# EasyEDA Pro project F411主控板优化版(1).epro

# Schematic Schematic1
Board Name: Board1; Create Date: 2025-06-30; Page Name: P1; Project Name: F411主控板优化版; Schematic Name: Schematic1; Update Date: 2025-06-30; Company: 嘉立创EDA; Page Size: A4; Version: V1.0
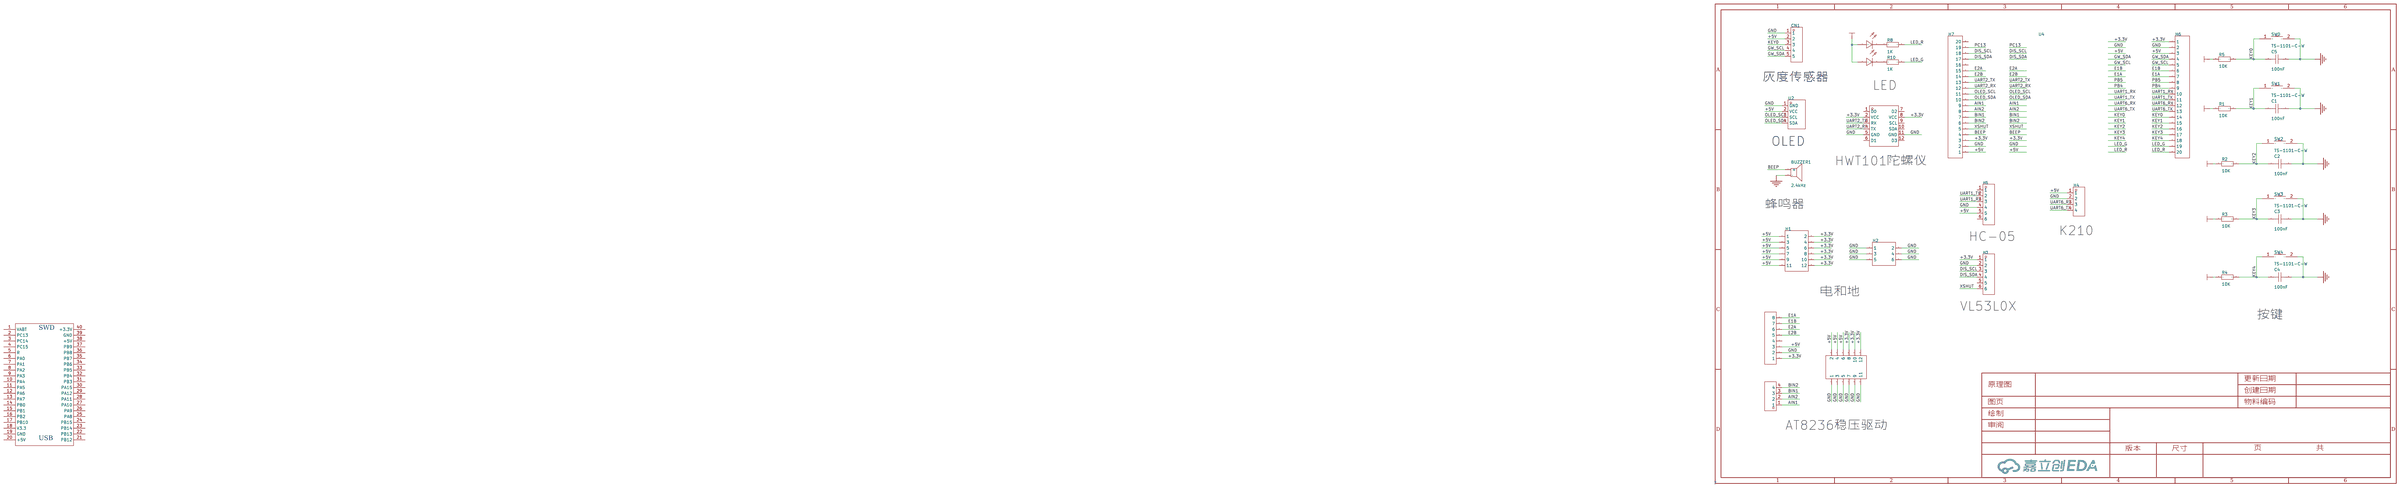
[diagram p0: schematic sheet]

## Parts
AT82361p4  -  [HDR-TH_4P-P2.54-V-F]
AT82362p6  -  [HDR-TH_12P-P2.54-V-M-R2-C6-S2.54]
BUZZER1  2.4kHz  [BUZ-TH_BD12.0-P7.60-D0.6-FD]
C1  100nF  [C0805]
C2  100nF  [C0805]
C3  100nF  [C0805]
C4  100nF  [C0805]
C5  100nF  [C0805]
CN1  灰度传感器  [CONN-TH_5P-P2.54_XH-5AW_C2908614]
H1  -  [HDR-TH_12P-P2.54-V-M-R2-C6-S2.54]
H2  -  [HDR-TH_6P-P2.54-V-F-R2-C3-S2.54]
H3  -  [HDR-TH_6P-P2.54-V-F]
H4  -  [HDR-TH_4P-P2.54-V-F]
H5  -  [HDR-TH_6P-P2.54-V-F]
H6  -  [HDR-TH_20P-P2.54-V-F]
H7  -  [HDR-TH_20P-P2.54-V-F]
LED1  -  [LED_TH-3mm]
LED2  -  [LED_TH-3mm]
R1  10K  [R0805]
R2  10K  [R0805]
R3  10K  [R0805]
R4  10K  [R0805]
R5  10K  [R0805]
R8  1K  [R0805_1]
R10  1K  [R0805_1]
SW0  TS-1101-C-W  [SW-SMD_L6.0-W3.3-LS8.0]
SW1  TS-1101-C-W  [SW-SMD_L6.0-W3.3-LS8.0]
SW2  TS-1101-C-W  [SW-SMD_L6.0-W3.3-LS8.0]
SW3  TS-1101-C-W  [SW-SMD_L6.0-W3.3-LS8.0]
SW4  TS-1101-C-W  [SW-SMD_L6.0-W3.3-LS8.0]
U1  -  [HDR-TH_8P-P2.54-V-F-1]
U2  OLED  [OLED-TH_L27.8-W27.2-P2.54_C9900033791]
U3  -  [HWT101]
U4  -  [STM32F411CEU6核心板]

## Library data of the parts
AT82361p4 H4 = HDR-F_2.54_1x4P: Supplier Part: C2718488; Supplier Footprint: 插件
AT82362p6 H1 = HDR-F_2.54_2x6
BUZZER1 = TMB12A05_C96093: 驱动方式:有源(内含驱动线路);构造类型:电磁式;额定电压:-;频率:2.4kHz;声压(SPL):85dB;; LCSC Part Name: TMB12A05; Supplier Part: C96093; Manufacturer: 华能; Manufacturer Part: TMB12A05; Supplier Footprint: 插件,D=12mm; JLCPCB Part Class: 扩展库; Datasheet: https://atta.szlcsc.com/upload/public/pdf/source/20241025/8A17FE04D767D19A35A06DEF9A82AB1E.pdf; Supplier: LCSC; Driver Circuitry: 有源(内含驱动线路); Technology: 电磁式; Voltage - Supply: 4V~8V; Sound Pressure Level(SPL): 85dB; Diameter(φD): 12mm; Height: 9.8mm
C1-C5 = CAP_0805: Supplier Footprint: 0805
CN1 = XH-5AW: 插针结构:1x5P;间距:2.54mm;安装方式:弯插;参考系列:XH;总PIN数:5P;排数:1;每排PIN数:5;行距:-;额定电流:3A;触头材质:黄铜;触头镀层:锡;工作温度范围:-25℃~+85℃;; LCSC Part Name: 1x5P 间距:2.54mm 弯插 系列:XH; Supplier Part: C2908614; Manufacturer: HCTL(华灿天禄); Supplier Footprint: 弯插,P=2.5mm; JLCPCB Part Class: 扩展库; Datasheet: https://atta.szlcsc.com/upload/public/pdf/source/20230711/B565BAF3B11666EF6B81B3605408F2BD.pdf; Supplier: LCSC; Pins Structure: 1x5P; Pitch: 2.54mm; Mounting Style: 弯插; Reference Series: XH; Number of Pins: 5P; Number of Rows: 1; Number of PINs Per Row: 5; Current Rating (Max): 3A; Contact Material: 黄铜; Contact Plating: 锡; Operating Temperature Range: -25℃~+85℃
H2 = HDR-F_2.54_2x3: Supplier Part: C92272; Supplier Footprint: 插件
H3 H5 = HDR-F_2.54_1x6P: Supplier Part: C40877; Supplier Footprint: 插件
H6 H7 = HDR-F_2.54_1x20P: Supplier Part: C50984; Supplier Footprint: 插件
LED1 = LED_TH-R_3mm: Supplier Footprint: 插件
LED2 = LED_TH-G_3mm: Supplier Footprint: 插件
R1-R5 = Res_0805: Supplier Footprint: 0805
R8 R10 = Res_0603: Supplier Footprint: 0603
SW0-SW4 = TS-1101-C-W: 电路结构:单刀单掷;按钮形状:矩形按钮;作用力:260gf;安装方式:立贴;开关长度:6mm;开关宽度:3.6mm;开关高度:2.5mm;带支架:不带;触点电流:50mA;额定电压(AC):-;额定电压(DC):12V;额定功率:-;绝缘电阻:-;带灯:无;机械寿命:5万次;; LCSC Part Name: 6*3.6*2.5mm 立贴 轻触开关; Supplier Part: C318938; Manufacturer: XKB Connectivity(中国星坤); Supplier Footprint: SMD; JLCPCB Part Class: 扩展库; Datasheet: https://atta.szlcsc.com/upload/public/pdf/source/20200227/C318938_C2E53B1EEDE37D980A33616AC086DE53.pdf; Supplier: LCSC; Circuit: 单刀单掷; Actuator Style: 矩形按钮; Operating Force: 260gf; Mounting Style: 立贴; Switch Length: 6mm; Switch Width: 3.6mm; Switch Height: 2.5mm; Strike Gundam: 不带; Contact Current: 50mA; Voltage Rating (DC): 12V; Actuator/Cap Color: 白色带淡绿; With Lamp: 无; Mechanical Life: 5万次; Operating Temperature: -30℃~+85℃
U1 = HDR-F_2.54_1x8P: Supplier Part: C27438; Supplier Footprint: 插件
U2 = HS96L03W2C03: 主控芯片:SSD1315;接口类型:I2C;尺寸(inch):0.96;像素分辨率:128x64;; LCSC Part Name: 0.96寸OLED显示屏窄白光IIC; Supplier Part: C5248080; Manufacturer: HS(汉昇); JLCPCB Part Class: 扩展库; Datasheet: https://atta.szlcsc.com/upload/public/pdf/source/20230627/763D01F79A90007632F098068C7C8AD9.pdf; Supplier: LCSC; Main Control Chip: SSD1315; Interface Type: I2C; Size: 0.96; Pixel Resolution: 128x64; Operating Temperature: -40℃~+70℃
U3 = HWT101: Pin Type: IN
U4 = STM32F411CEU6核心板

## Nets
+3.3V: AT82362p6.8 AT82362p6.10 AT82362p6.12 H1.2 H1.4 H1.6 H1.8 H1.10 H1.12 H3.1 H6.1 H7.3 LED1.1(C) LED2.1(C) R1.1 R2.1 R3.1 R4.1 R5.1 U1.1 U3.2(VCC) U3.8(VCC)
+5V: AT82362p6.2 AT82362p6.4 AT82362p6.6 CN1.2 H1.1 H1.3 H1.5 H1.7 H1.9 H1.11 H4.1 H5.5 H6.3 H7.1 U1.3 U2.2(VCC)
GND: AT82362p6.1 AT82362p6.3 AT82362p6.5 AT82362p6.7 AT82362p6.9 AT82362p6.11 BUZZER1.2 C1.2 C2.2 C3.2 C4.2 C5.2 CN1.1 H2.1 H2.2 H2.3 H2.4 H2.5 H2.6 H3.2 H4.2 H5.4 H6.2 H7.2 SW0.2 SW1.2 SW2.2 SW3.2 SW4.2 U1.2 U2.1(GND) U3.5(GND) U3.11(GND)
AIN1: AT82361p4.1 H7.9
AIN2: AT82361p4.2 H7.8
BEEP: BUZZER1.1(+) H7.4
BIN1: AT82361p4.3 H7.7
BIN2: AT82361p4.4 H7.6
DIS_SCL: H3.3 H7.18
DIS_SDA: H3.4 H7.17
E1A: H6.7 U1.8
E1B: H6.6 U1.7
E2A: H7.15 U1.6
E2B: H7.14 U1.5
GW_SCL: CN1.4 H6.5
GW_SDA: CN1.5 H6.4
KEY0: C5.1 CN1.3 H6.14 R5.2 SW0.1
KEY1: C1.1 H6.15 R1.2 SW1.1
KEY2: C2.1 H6.16 R2.2 SW2.1
KEY3: C3.1 H6.17 R3.2 SW3.1
KEY4: C4.1 H6.18 R4.2 SW4.1
LED_G: H6.19 R10.2
LED_R: H6.20 R8.2
OLED_SCL: H7.11 U2.3(SCL)
OLED_SDA: H7.10 U2.4(SDA)
PB4: H6.9
PB5: H6.8
PC13: H7.19
UART1_RX: H5.3 H6.10
UART1_TX: H5.2 H6.11
UART2_RX: H7.12 U3.4(TX)
UART2_TX: H7.13 U3.3(RX)
UART6_RX: H4.3 H6.12
UART6_TX: H4.4 H6.13
XSHUT: H3.6 H7.5
Net-(LED1-2): LED1.2(A) R8.1
Net-(LED2-2): LED2.2(A) R10.1

Not connected (* = marked no-connect by the designer): H3 5; H5 1 6; H7 16 20; U1 4; U3 1(D0) 6(D1) 7(D2) 9(SCL) 10(SDA) 12(D3); U4 1(VABT) 2(PC13) 3(PC14) 4(PC15) 5(R) 6(PA0) 7(PA1) 8(PA2) 9(PA3) 10(PA4) 11(PA5) 12(PA6) 13(PA7) 14(PB0) 15(PB1) 16(PB2) 17(PB10) 18(V3.3) 19(GND) 20(+5V) 21(PB12) 22(PB13) 23(PB14) 24(PB15) 25(PA8) 26(PA9) 27(PA10) 28(PA11) 29(PA12) 30(PA15) 31(PB3) 32(PB4) 33(PB5) 34(PB6) 35(PB7) 36(PB8) 37(PB9) 38(+5V) 39(GND) 40(+3.3V)

## Notes on the sheet
- LED
- HWT101陀螺仪
- 蜂鸣器
- K210
- HC-05
- 电和地
- VL53L0X
- 按键
- AT8236稳压驱动

# Board PCB1
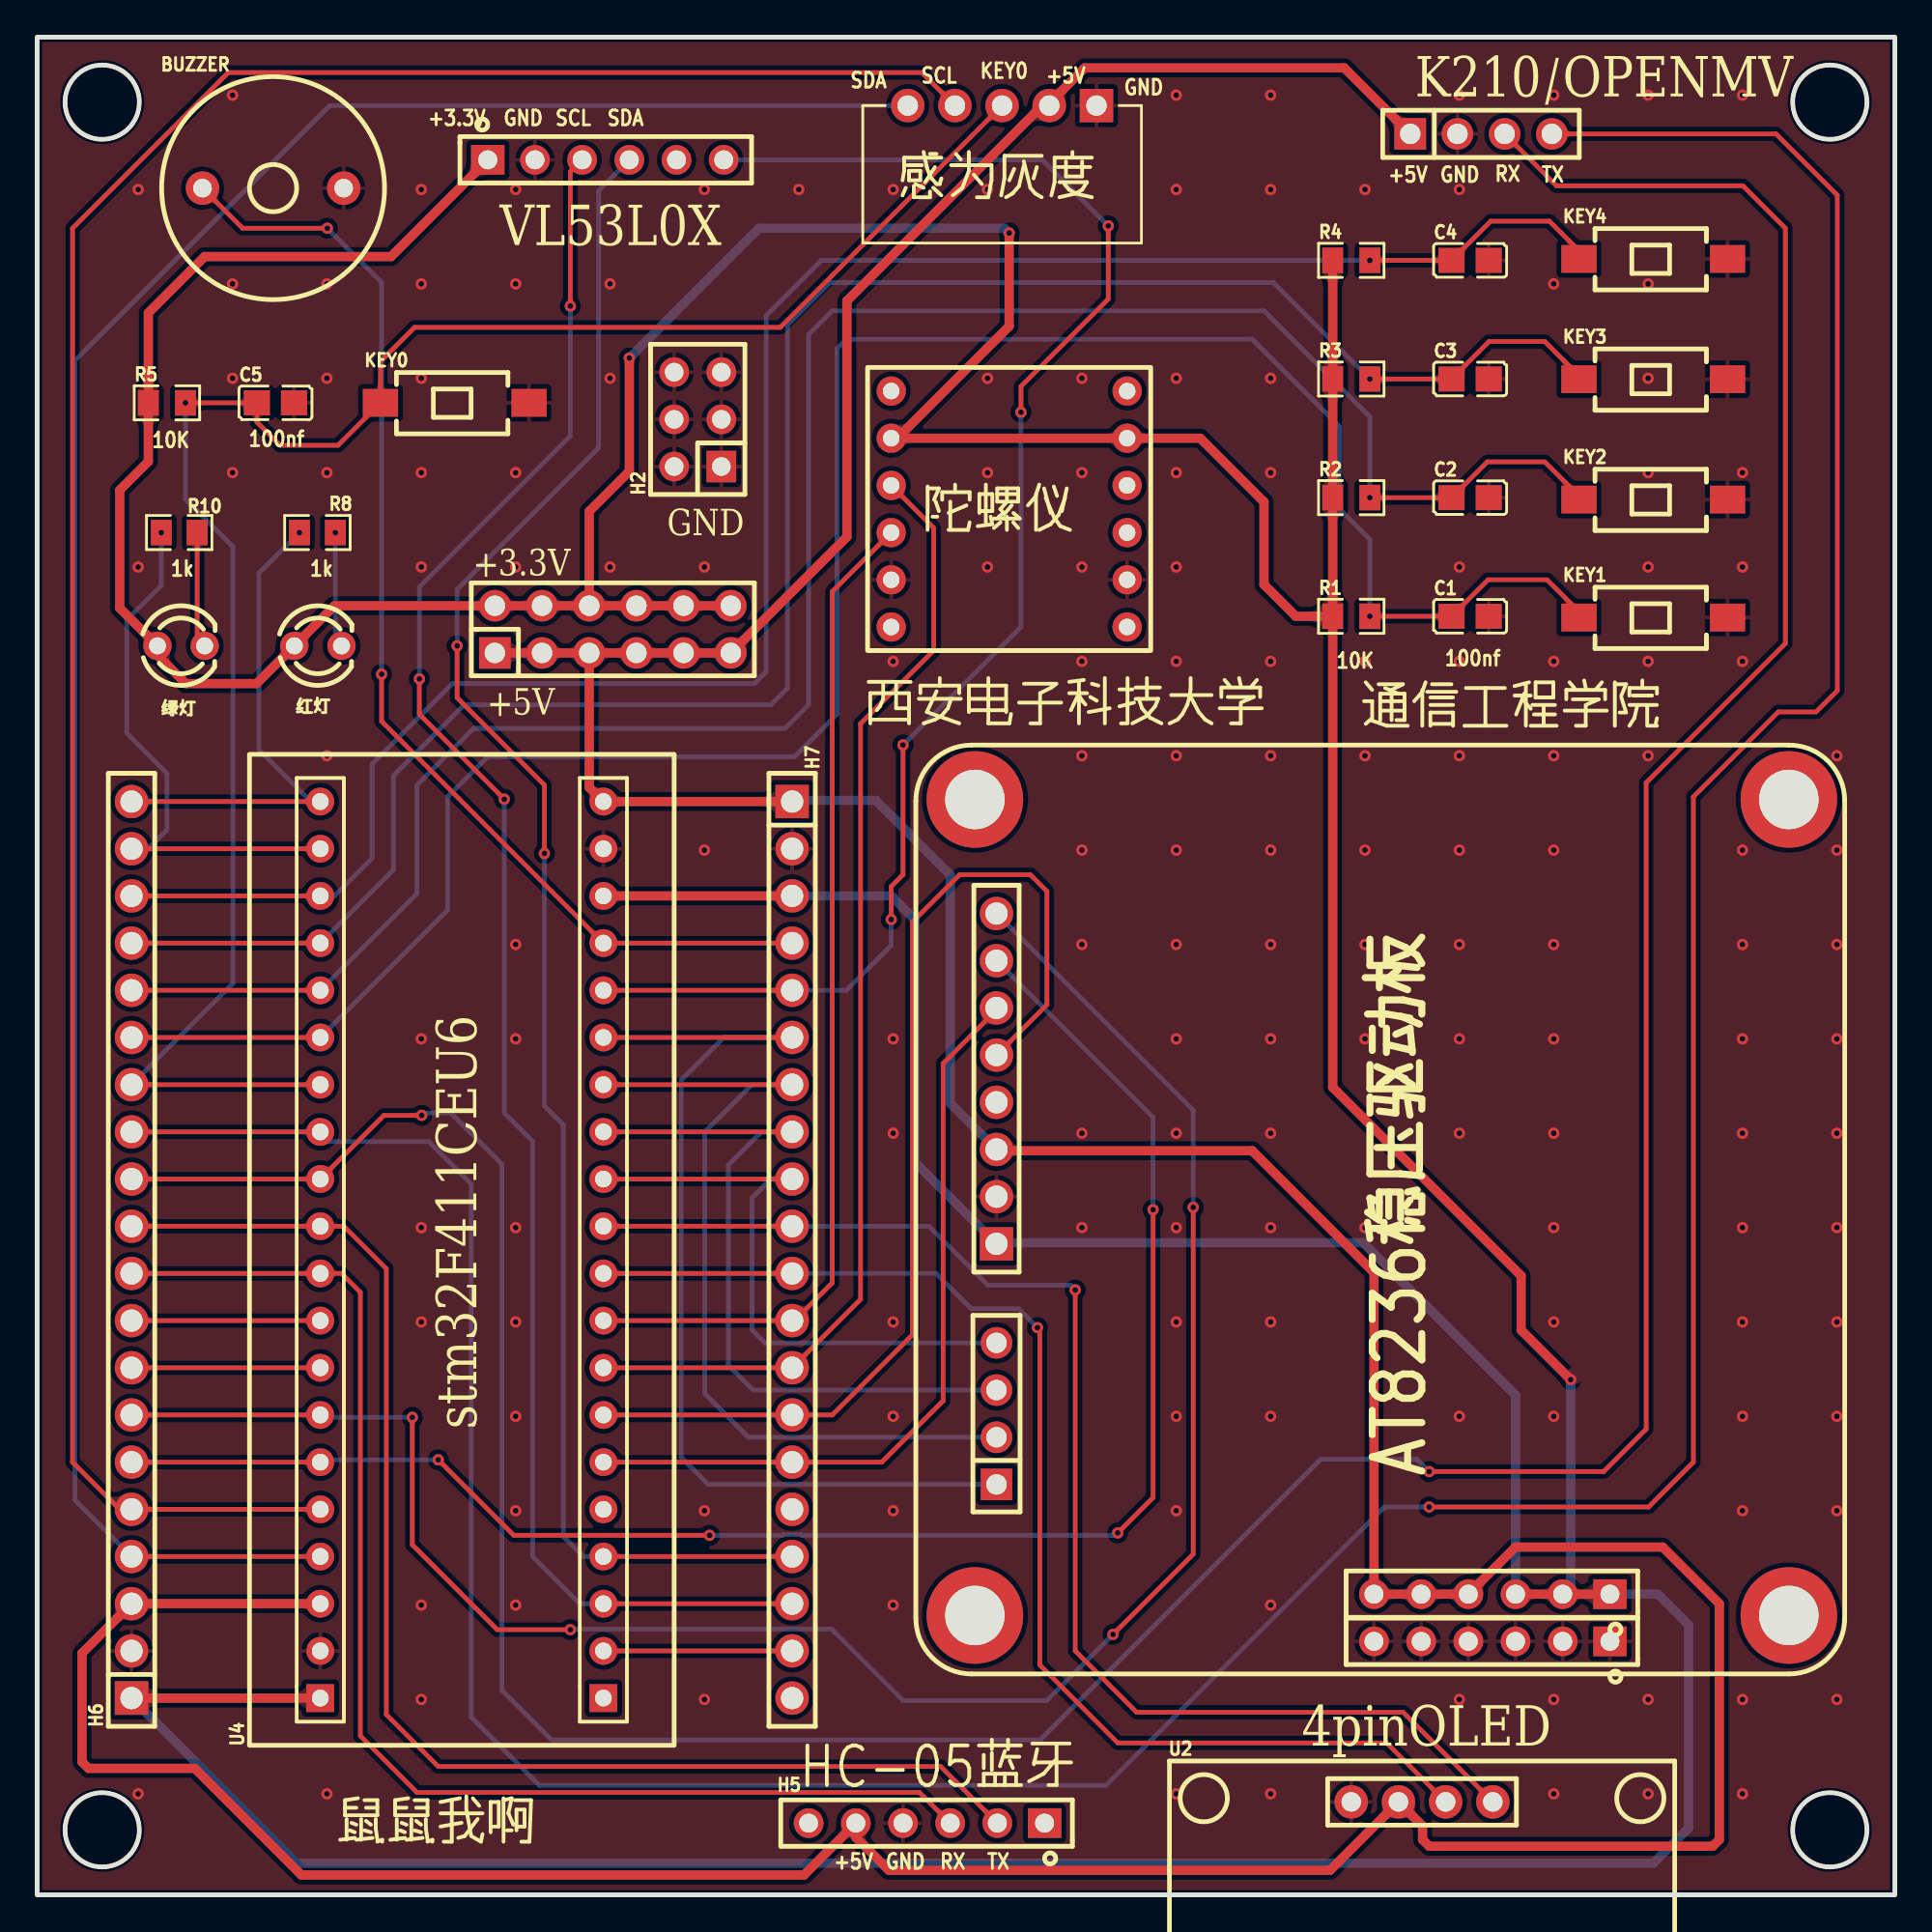
[diagram p1: board, top side]
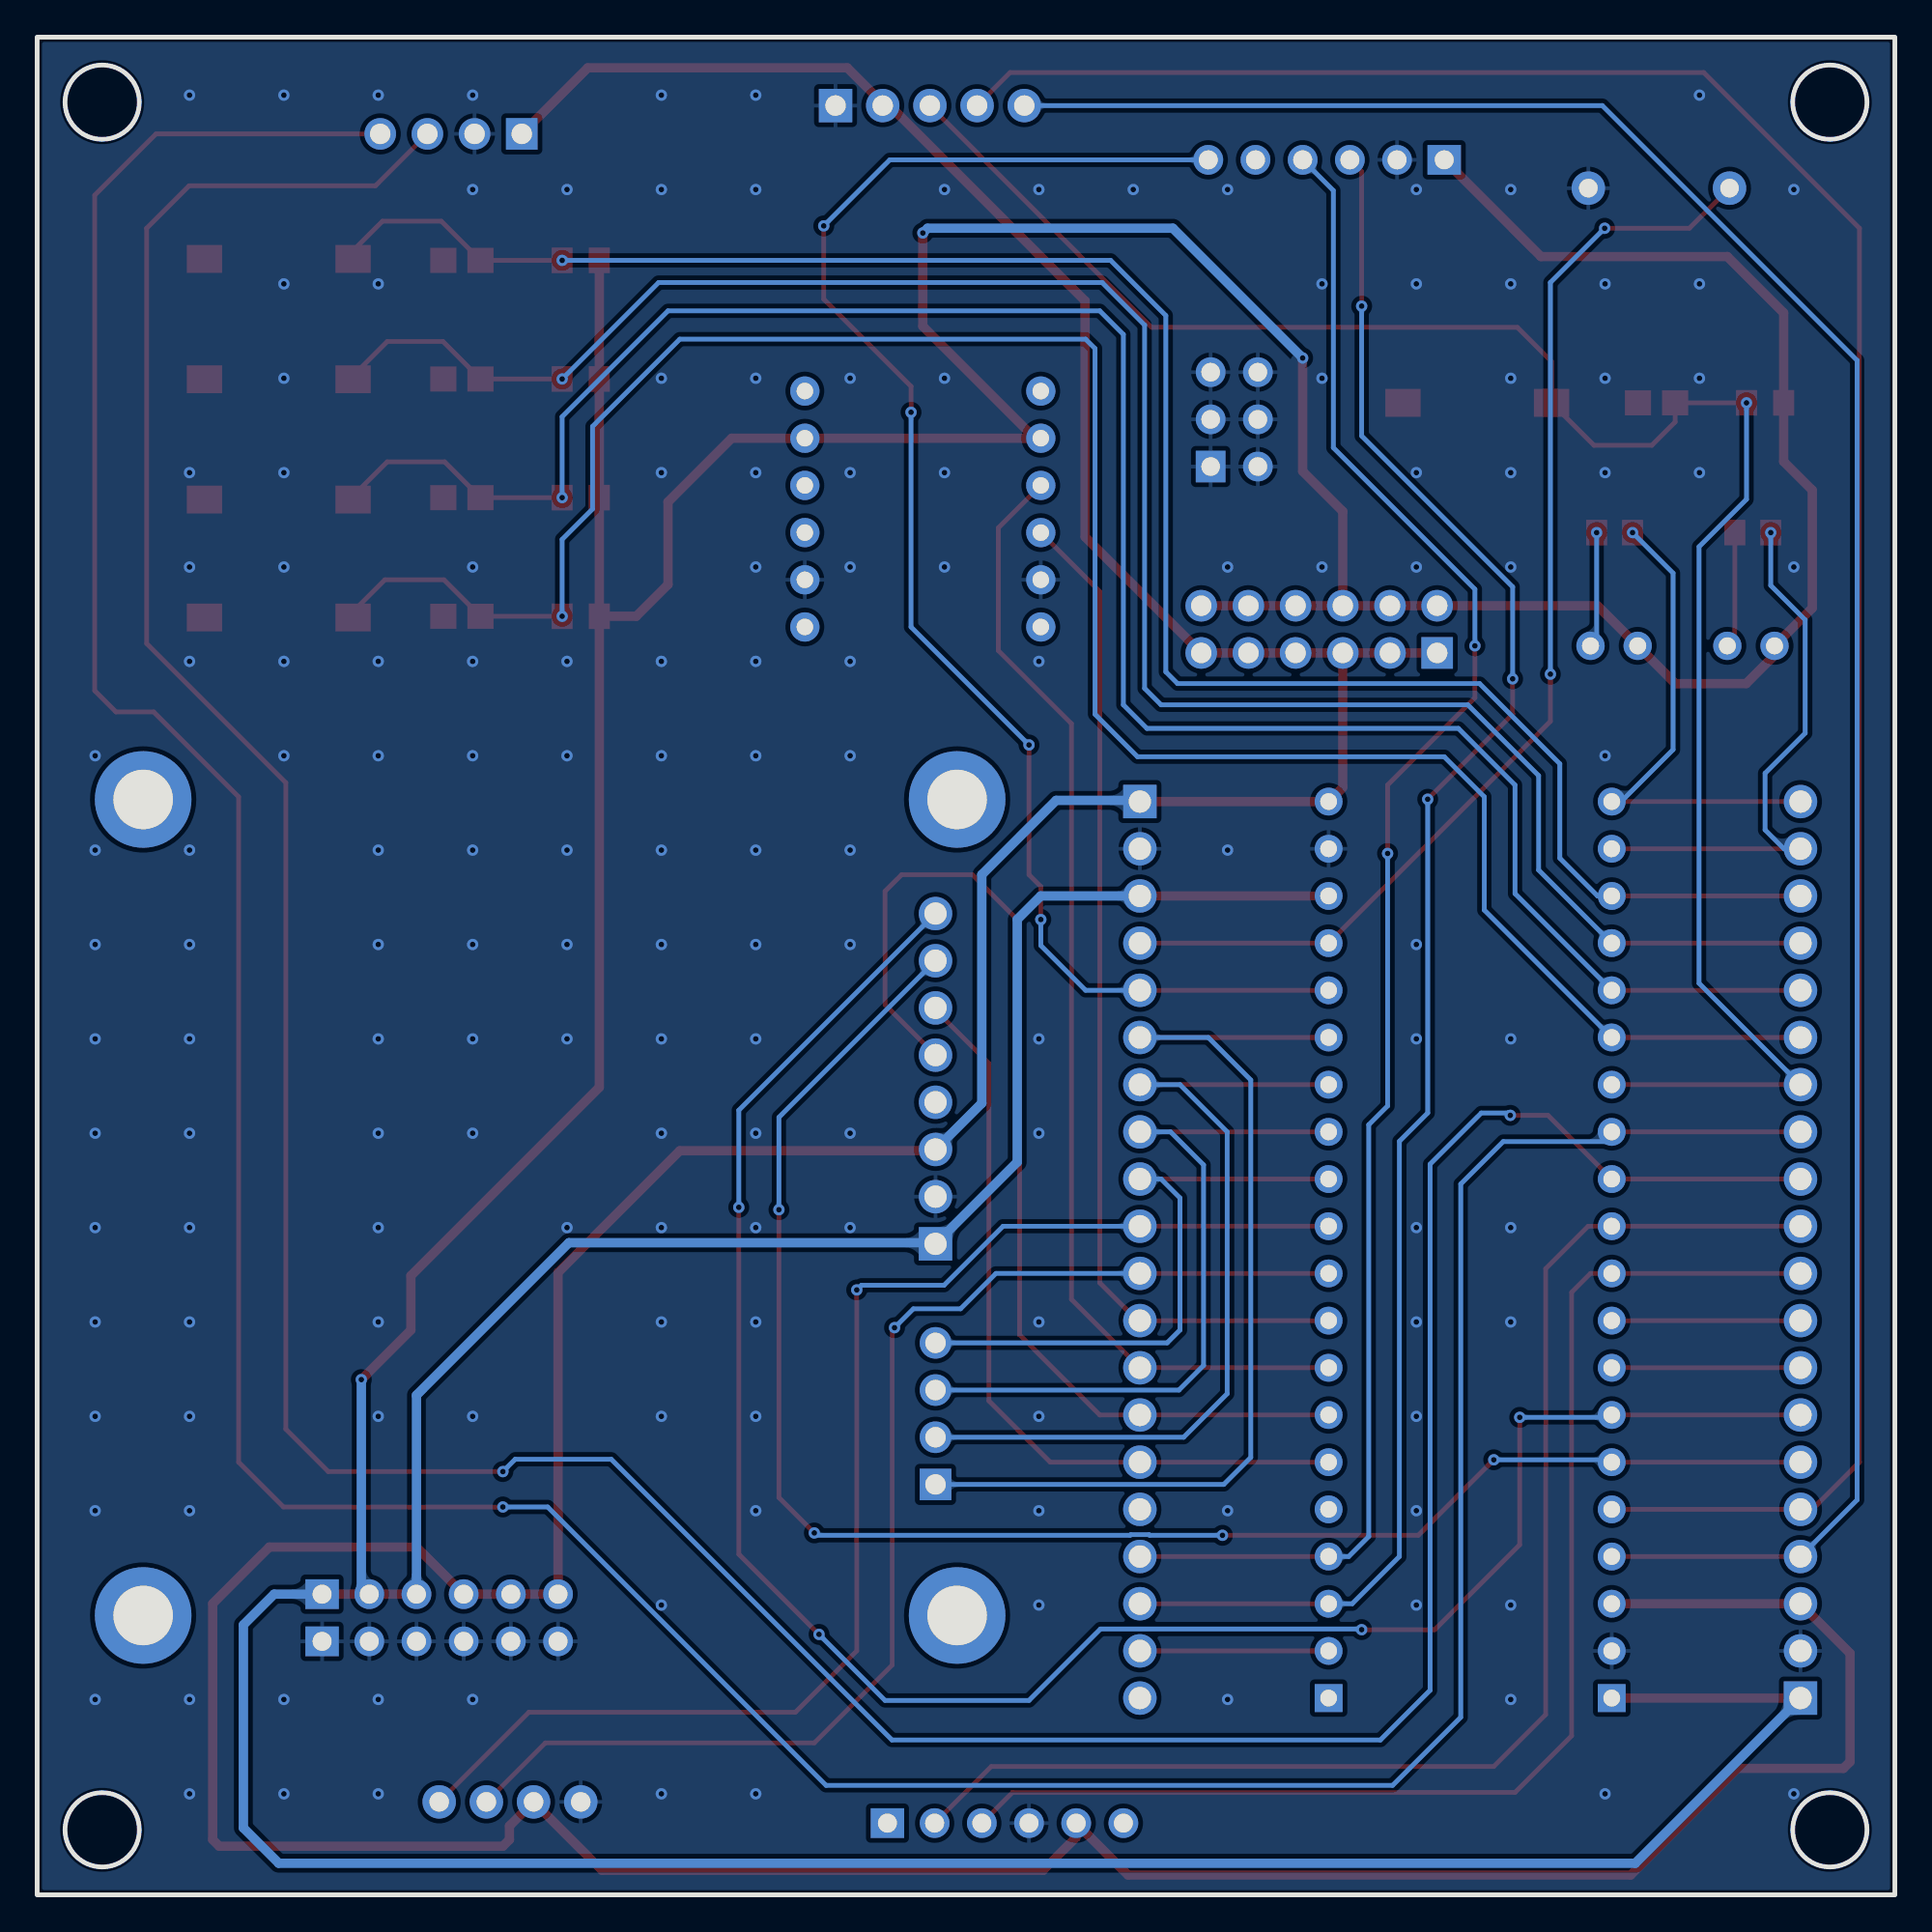
[diagram p2: board, bottom side, seen from below]

Outline 100 x 100 mm; copper layers: Top Layer, Bottom Layer. Coordinates in mm from the lower left corner of the outline.
Outline path: rectangle 0,100 100,0 ; circle c3.5,96.5 r2 ; circle c3.5,3.5 r2 ; circle c96.5,96.5 r2 ; circle c96.5,3.5 r2
Stack: Top Layer 0.035mm / Dielectric1 1.51mm FR4 er 4.5 / Bottom Layer 0.035mm

## Design rules (mm)
template: JLCPCB Capability(Two Layers Board)
spacing copperThickness1oz (default): track to track 0.102, other pairs 0.152 to 0.3
spacing copperThickness2oz: track to track 0.203, other pairs 0.152 to 0.3
track width copperThickness1oz (default): min 0.127, default 0.254, max 2.54
track width copperThickness2oz: min 0.203, default 0.254, max 2.54
differential pair differentialPair (default): width min 0.127, default 0.254, max 2.54; gap min 0.152, default 0.152
via viaSize (default): diameter min 0.5, default 0.61, max 10; hole min 0.3, default 0.305, max 6.3

## Placement (name value [footprint] x y rotation side)
BUZZER  2.4kHz  [BUZ-TH_BD12.0-P7.60-D0.6-FD]  12.7 91.87 0 top
C1  100nF  [C0805]  77.14 68.83 0 top
C2  100nF  [C0805]  77.14 75.21 0 top
C3  100nF  [C0805]  77.14 81.6 0 top
C4  100nF  [C0805]  77.14 87.98 0 top
C5  100nF  [C0805]  12.83 80.31 0 top
CN1  灰度传感器  [CONN-TH_5P-P2.54_XH-5AW_C2908614]  51.94 96.32 180 top
H1  -  [HDR-TH_12P-P2.54-V-M-R2-C6-S2.54]  30.99 68.12 0 top
H2  -  [HDR-TH_6P-P2.54-V-F-R2-C3-S2.54]  35.56 79.43 90 top
H3  -  [HDR-TH_6P-P2.54-V-F]  30.61 93.4 0 top
H4  -  [HDR-TH_4P-P2.54-V-F]  77.72 94.79 0 top
H5  -  [HDR-TH_6P-P2.54-V-F]  47.88 3.86 180 top
H6  -  [HDR-TH_20P-P2.54-V-F]  5.08 34.72 90 top
H7  -  [HDR-TH_20P-P2.54-V-F]  40.64 34.72 270 top
H20  -  [HDR-TH_8P-P2.54-V-F-1]  51.64 43.93 90 top
H21  -  [HDR-TH_4P-P2.54-V-F]  51.64 25.9 90 top
H22  -  [HDR-TH_6P-P2.54-V-F]  78.31 13.65 180 top
H23  -  [HDR-TH_6P-P2.54-V-F]  78.31 16.19 180 top
KEY0  TS-1101-C-W  [SW-SMD_L6.0-W3.3-LS8.0]  22.48 80.31 0 top
KEY1  TS-1101-C-W  [SW-SMD_L6.0-W3.3-LS8.0]  87 68.76 0 top
KEY2  TS-1101-C-W  [SW-SMD_L6.0-W3.3-LS8.0]  87 75.11 0 top
KEY3  TS-1101-C-W  [SW-SMD_L6.0-W3.3-LS8.0]  87 81.58 0 top
KEY4  TS-1101-C-W  [SW-SMD_L6.0-W3.3-LS8.0]  87 88.06 0 top
R1  10K  [R0805]  70.74 68.83 0 top
R2  10K  [R0805]  70.74 75.21 0 top
R3  10K  [R0805]  70.74 81.6 0 top
R4  10K  [R0805]  70.74 87.98 0 top
R5  10K  [R0805]  6.98 80.31 0 top
R8  1K  [R0805_1]  15.09 73.33 180 top
R10  1K  [R0805_1]  7.65 73.33 180 top
SCREW3  -  [M3螺丝]  94.29 58.97 90 top
SCREW5  -  [M3螺丝]  94.29 15.04 90 top
SCREW6  -  [M3螺丝]  50.48 58.97 90 top
SCREW7  -  [M3螺丝]  50.48 15.04 90 top
U2  OLED  [OLED-TH_L27.8-W27.2-P2.54_C9900033791]  74.55 5 0 top
U3  -  [HWT101]  52.32 74.6 0 top
U4  -  [STM32F411CEU6核心板]  11.3 7.93 90 top
红灯  -  [LED_TH-3mm]  15.11 67.23 0 top
绿灯  -  [LED_TH-3mm]  7.75 67.23 0 top

## Footprints (pads in the part's own frame, mm; a bottom-side part is the same pattern mirrored in y, then rotated)
BUZ-TH_BD12.0-P7.60-D0.6-FD
  round 1.8 hole 1: 1(-3.8,0) 2(3.8,0)
C0805
  rect 1.41x1.35 smd: 1(-1,0) 2(1,0)
CONN-TH_5P-P2.54_XH-5AW_C2908614
  rect 1.8x1.8 hole 1.1: 1(-5.08,0)
  round 1.8 hole 1.1: 2(-2.54,0) 3(0,0) 4(2.54,0) 5(5.08,0)
HDR-TH_4P-P2.54-V-F
  rect 1.7x1.7 hole 1.1: 1(-3.81,0)
  round 1.7 hole 1.1: 2(-1.27,0) 3(1.27,0) 4(3.81,0)
HDR-TH_6P-P2.54-V-F
  rect 1.8x1.6 hole 1.02: 1(-6.35,0)
  round 1.6 hole 1.02: 2(-3.81,0) 3(-1.27,0) 4(1.27,0) 5(3.81,0) 6(6.35,0)
HDR-TH_6P-P2.54-V-F-R2-C3-S2.54
  rect 1.7x1.6 hole 1: 1(-2.54,-1.27)
  round 1.6 hole 1: 2(-2.54,1.27) 3(0,-1.27) 4(0,1.27) 5(2.54,-1.27) 6(2.54,1.27)
HDR-TH_8P-P2.54-V-F-1
  rect 1.8x1.8 hole 1.2: 1(-8.89,0)
  round 1.8 hole 1.2: 2(-6.35,0) 3(-3.81,0) 4(-1.27,0) 5(1.27,0) 6(3.81,0) 7(6.35,0) 8(8.89,0)
HDR-TH_12P-P2.54-V-M-R2-C6-S2.54
  rect 1.7x1.7 hole 1.1: 1(-6.35,-1.27)
  round 1.7 hole 1.1: 2(-6.35,1.27) 3(-3.81,-1.27) 4(-3.81,1.27) 5(-1.27,-1.27) 6(-1.27,1.27) 7(1.27,-1.27) 8(1.27,1.27) 9(3.81,-1.27) 10(3.81,1.27) 11(6.35,-1.27) 12(6.35,1.27)
HDR-TH_20P-P2.54-V-F
  rect 1.8x1.8 hole 1.2: 1(-24.13,0)
  round 1.8 hole 1.2: 2(-21.59,0) 3(-19.05,0) 4(-16.51,0) 5(-13.97,0) 6(-11.43,0) 7(-8.89,0) 8(-6.35,0) 9(-3.81,0) 10(-1.27,0) 11(1.27,0) 12(3.81,0) 13(6.35,0) 14(8.89,0) 15(11.43,0) 16(13.97,0) 17(16.51,0) 18(19.05,0) 19(21.59,0) 20(24.13,0)
HWT101
  round 1.575 hole 0.889: 1(-6.35,6.35) 2(-6.35,3.81) 3(-6.35,1.27) 4(-6.35,-1.27) 5(-6.35,-3.81) 6(-6.35,-6.35) 7(6.35,6.35) 8(6.35,3.81) 9(6.35,1.27) 10(6.35,-1.27) 11(6.35,-3.81) 12(6.35,-6.35)
LED_TH-3mm
  round 1.524 hole 0.914: 1(-1.27,0) 2(1.27,0)
M3螺丝
  round 5.2 hole 3.2: 1(0,0)
OLED-TH_L27.8-W27.2-P2.54_C9900033791
  round 1.8 hole 1.05: 1(-3.81,0) 2(-1.27,0) 3(1.27,0) 4(3.81,0)
R0805
  rect 1.133x1.377 smd: 1(-1,0) 2(1,0)
R0805_1
  rect 1.133x1.377 smd: 1(-0.966,0) 2(0.966,0)
STM32F411CEU6核心板
  rect 1.5x1.5 hole 0.9: 1(2.667,-19.177)
  round 1.5 hole 0.9: 2(5.207,-19.177) 3(7.747,-19.177) 4(10.287,-19.177) 5(12.827,-19.177) 6(15.367,-19.177) 7(17.907,-19.177) 8(20.447,-19.177) 9(22.987,-19.177) 10(25.527,-19.177) 11(28.067,-19.177) 12(30.607,-19.177) 13(33.147,-19.177) 14(35.687,-19.177) 15(38.227,-19.177) 16(40.767,-19.177) 17(43.307,-19.177) 18(45.847,-19.177) 19(48.387,-19.177) 20(50.927,-19.177)
  round 1.5 hole 0.905x0.9: 21(50.927,-3.937) 22(48.387,-3.937) 23(45.847,-3.937) 24(43.307,-3.937) 25(40.767,-3.937) 26(38.227,-3.937) 27(35.687,-3.937) 28(33.147,-3.937) 29(30.607,-3.937) 30(28.067,-3.937) 31(25.527,-3.937) 32(22.987,-3.937) 33(20.447,-3.937) 34(17.907,-3.937) 35(15.367,-3.937) 36(12.827,-3.937) 37(10.287,-3.937) 38(7.747,-3.937) 39(5.207,-3.937)
  rect 1.5x1.5 hole 0.905x0.9: 40(2.667,-3.937)
SW-SMD_L6.0-W3.3-LS8.0
  rect 1.9x1.5 smd: 1(-4,0) 2(4,0)

## Nets
+3.3V: H1.2 H1.4 H1.6 H1.8 H1.10 H1.12 H3.1 H6.1 H7.3 H20.1 H23.1 H23.2 H23.3 R1.1 R2.1 R3.1 R4.1 R5.1 U3.2 U3.8 U4.18 U4.40 红灯.1 绿灯.1
+5V: CN1.2 H1.1 H1.3 H1.5 H1.7 H1.9 H1.11 H4.1 H5.5 H6.3 H7.1 H20.3 H23.4 H23.5 H23.6 U2.2 U4.20 U4.38
GND: BUZZER.2 C1.2 C2.2 C3.2 C4.2 C5.2 CN1.1 H2.1 H2.2 H2.3 H2.4 H2.5 H2.6 H3.2 H4.2 H5.4 H6.2 H7.2 H20.2 H22.1 H22.2 H22.3 H22.4 H22.5 H22.6 KEY0.2 KEY1.2 KEY2.2 KEY3.2 KEY4.2 U2.1 U3.5 U3.11 U4.19 U4.39
AIN1: H7.9 H21.4 U4.12
AIN2: H7.8 H21.3 U4.13
BEEP: BUZZER.1 H7.4 U4.17
BIN1: H7.7 H21.2 U4.14
BIN2: H7.6 H21.1 U4.15
DIS_SCL: H3.3 H7.18 U4.3
DIS_SDA: H3.4 H7.17 U4.4
E1A: H6.7 H20.8 U4.34
E1B: H6.6 H20.7 U4.35
E2A: H7.15 H20.6 U4.6
E2B: H7.14 H20.5 U4.7
GW_SCL: CN1.4 H6.5 U4.36
GW_SDA: CN1.5 H6.4 U4.37
KEY0: C5.1 CN1.3 H6.14 KEY0.1 R5.2 U4.27
KEY1: C1.1 H6.15 KEY1.1 R1.2 U4.26
KEY2: C2.1 H6.16 KEY2.1 R2.2 U4.25
KEY3: C3.1 H6.17 KEY3.1 R3.2 U4.24
KEY4: C4.1 H6.18 KEY4.1 R4.2 U4.23
LED_G: H6.19 R10.2 U4.22
LED_R: H6.20 R8.2 U4.21
OLED_SCL: H7.11 U2.3 U4.10
OLED_SDA: H7.10 U2.4 U4.11
PB2: H3.6 H7.5 U4.16
PB4: H6.9 U4.32
PB5: H6.8 U4.33
PC13: H7.19 U4.2
UART1_RX: H5.3 H6.10 U4.31
UART1_TX: H5.2 H6.11 U4.30
UART2_RX: H7.12 U3.4 U4.9
UART2_TX: H7.13 U3.3 U4.8
UART6_RX: H4.3 H6.12 U4.29
UART6_TX: H4.4 H6.13 U4.28
$1N1648: R8.1 红灯.2
$1N1649: R10.1 绿灯.2

Pads without a net: H3 5; H5 1 6; H7 16 20; H20 4; SCREW3 1; SCREW5 1; SCREW6 1; SCREW7 1; U3 1 6 7 9 10 12; U4 1 5

## Via types
v1: diameter 0.61, hole 0.305, Top Layer to Bottom Layer, 193 vias

## Routing (per net, layer and track width the routed paths; a pad name or vN(x,y) marks a point on that pad's centre or on a via; arc(x,y) is an arc through that point)
+3.3V: length 431.7
  Top Layer w0.5: H6.1 U4.40 ; U3.2 46.29,78.41 ; 46.29,78.41 U3.8 62.61,78.41 66.04,74.98 66.04,70.54 67.75,68.83 R1.1 ; 46.29,78.41 52.32,84.44 v1(52.32,89.46) ; v1(31.88,82.73) 31.88,76.63 29.72,74.47 H1.6 ; H1.6 H1.8 H1.10 H1.12 ; H1.6 H1.4 H1.2 16,69.39 红灯.1 11.81,65.2 8,65.2 6.48,66.73 绿灯.1 4.44,69.27 4.44,75.62 5.98,77.16 R5.1 5.98,85.16 9.02,88.19 19.05,88.19 H3.1 ; U4.18 H7.3 ; H23.3 H23.2 H23.1 ; R4.1 R3.1 R2.1 R1.1 ; R1.1 69.74,43.47 79.88,33.33 79.88,30.4 v1(82.55,27.74)
  Bottom Layer w0.5: H23.1 87.24,16.19 88.9,14.53 88.9,3.61 87,1.7 13.97,1.7 H6.1 ; H23.2 82.55,16.61 v1(82.55,27.74) ; H23.3 79.58,26.9 71.37,35.1 51.7,35.1 H20.1 47.24,39.44 47.24,52.5 45.97,53.77 H7.3 ; v1(52.32,89.46) 52.07,89.71 38.86,89.71 v1(31.88,82.73)
+5V: length 306
  Top Layer w0.5: 29.72,66.85 24.64,66.85 ; 29.72,66.85 29.72,59.61 U4.20 H7.1 ; 29.72,66.85 37.34,66.85 43.59,73.1 43.59,85.8 54.1,96.32 CN1.2 54.48,96.44 56.39,98.35 70.36,98.35 H4.1 ; U4.38 H6.3 2.41,13 2.41,7.16 2.77,6.81 8.48,6.81 14.22,1.07 41.28,1.07 H5.5 44.07,3.1 45.85,1.32 69.6,1.32 U2.2 74.58,3.71 74.58,2.97 74.93,2.62 90.2,2.62 90.55,2.97 90.55,15.67 87.5,18.72 79.58,18.72 H23.4 H23.5 H23.6 71.96,33.5 65.41,40.06 51.71,40.06 H20.3
  Bottom Layer w0.5: H7.1 40.7,58.92 45.15,58.92 49.15,54.92 49.15,42.62 H20.3
GND:
  vias: v1(5.44,91.8) v1(5.44,71.48) v1(5.44,5.44) v1(10.52,96.88) v1(10.52,86.72) v1(10.52,81.64) v1(10.52,76.56) v1(15.6,86.72) v1(15.6,81.64) v1(15.6,76.56) v1(15.6,61.32) v1(15.6,5.44) v1(20.68,91.8) v1(20.68,86.72) v1(20.68,81.64) v1(20.68,76.56) v1(20.68,71.48) v1(20.68,46.08) v1(20.68,35.92) v1(20.68,30.84) v1(20.68,15.6) v1(20.68,10.52) v1(25.76,91.8) v1(25.76,86.72) v1(25.76,76.56) v1(25.76,71.48) v1(25.76,51.16) v1(25.76,46.08) v1(25.76,35.92) v1(25.76,30.84) v1(25.76,25.76) v1(25.76,20.68) v1(25.76,15.6) v1(30.84,86.72) v1(30.84,81.64) v1(30.84,71.48) v1(35.92,91.8) v1(35.92,71.48) v1(35.92,56.24) v1(35.92,20.68) v1(35.92,10.52) v1(41,91.8) v1(46.08,91.8) v1(46.08,66.4) v1(46.08,46.08) v1(46.08,41) v1(46.08,30.84) v1(46.08,25.76) v1(46.08,20.68) v1(46.08,15.6) v1(51.16,91.8) v1(51.16,81.64) v1(51.16,76.56) v1(51.16,71.48) v1(56.24,81.64) v1(56.24,76.56) v1(56.24,71.48) v1(56.24,66.4) v1(56.24,61.32) v1(56.24,56.24) v1(56.24,51.16) v1(56.24,41) v1(56.24,35.92) v1(61.32,96.88) v1(61.32,91.8) v1(61.32,81.64) v1(61.32,76.56) v1(61.32,71.48) v1(61.32,66.4) v1(61.32,61.32) v1(61.32,56.24) v1(61.32,51.16) v1(61.32,46.08) v1(61.32,41) v1(61.32,35.92) v1(61.32,30.84) v1(61.32,25.76) v1(61.32,20.68) v1(61.32,5.44) v1(66.4,96.88) v1(66.4,91.8) v1(66.4,81.64) v1(66.4,76.56) v1(66.4,66.4) v1(66.4,61.32) v1(66.4,56.24) v1(66.4,51.16) v1(66.4,46.08) v1(66.4,41) v1(66.4,35.92) v1(66.4,30.84) v1(66.4,25.76) v1(66.4,15.6) v1(66.4,5.44) v1(71.48,91.8) v1(71.48,66.4) v1(71.48,61.32) v1(71.48,56.24) v1(71.48,51.16) v1(71.48,46.08) v1(71.48,35.92) v1(76.56,96.88) v1(76.56,91.8) v1(76.56,71.48) v1(76.56,66.4) v1(76.56,61.32) v1(76.56,56.24) v1(76.56,51.16) v1(76.56,46.08) v1(76.56,41) v1(76.56,25.76) v1(76.56,10.52) v1(81.64,96.88) v1(81.64,86.72) v1(81.64,66.4) v1(81.64,61.32) v1(81.64,56.24) v1(81.64,51.16) v1(81.64,46.08) v1(81.64,41) v1(81.64,35.92) v1(81.64,30.84) v1(81.64,25.76) v1(81.64,10.52) v1(81.64,5.44) v1(86.72,96.88) v1(86.72,86.72) v1(86.72,81.64) v1(86.72,76.56) v1(86.72,71.48) v1(86.72,66.4) v1(86.72,61.32) v1(86.72,10.52) v1(86.72,5.44) v1(91.8,96.88) v1(91.8,76.56) v1(91.8,71.48) v1(91.8,66.4) v1(91.8,56.24) v1(91.8,51.16) v1(91.8,46.08) v1(91.8,41) v1(91.8,35.92) v1(91.8,30.84) v1(91.8,25.76) v1(91.8,20.68) v1(91.8,10.52) v1(91.8,5.44) v1(96.88,61.32) v1(96.88,56.24) v1(96.88,51.16) v1(96.88,46.08) v1(96.88,41) v1(96.88,35.92) v1(96.88,30.84) v1(96.88,25.76) v1(96.88,20.68) v1(96.88,10.52)
AIN1: length 33.3
  Top Layer w0.254: H7.9 U4.12
  Bottom Layer w0.254: H7.9 39.5,38.53 38.48,37.52 38.48,30.4 39.17,29.71 H21.4
AIN2: length 40.1
  Top Layer w0.254: U4.13 H7.8
  Bottom Layer w0.254: H21.3 38.54,27.17 37.21,28.5 37.21,39.29 38.99,41.07 H7.8
BEEP: length 62.4
  Top Layer w0.254: v1(15.62,89.71) 11.06,89.71 BUZZER.1 ; H7.4 U4.17 18.54,63.17 v1(18.54,65.71)
  Bottom Layer w0.254: v1(15.62,89.71) 18.54,86.79 v1(18.54,65.71)
BIN1: length 46.7
  Top Layer w0.254: H7.7 U4.14
  Bottom Layer w0.254: H7.7 38.48,43.61 35.94,41.07 35.94,26.97 38.28,24.63 H21.2
BIN2: length 55
  Top Layer w0.254: U4.15 H7.6
  Bottom Layer w0.254: H21.1 36.12,22.09 34.67,23.55 34.67,43.87 36.96,46.15 H7.6
DIS_SCL: length 96.4
  Top Layer w0.254: v1(28.7,85.52) 28.7,92.76 H3.3 ; v1(25.15,58.98) 20.57,63.55 v1(20.57,65.46) ; H7.18 U4.3
  Bottom Layer w0.254: v1(28.7,85.52) 28.7,78.54 20.57,70.41 v1(20.57,65.46) ; U4.3 29.21,15.67 26.67,18.21 26.67,40.56 25.15,42.09 v1(25.15,58.98)
DIS_SDA: length 93.1
  Top Layer w0.254: U4.4 H7.17 ; v1(22.61,67.23) 22.61,64.44 27.31,59.74 v1(27.31,56.06)
  Bottom Layer w0.254: H3.4 30.23,91.75 30.23,77.9 22.61,70.28 v1(22.61,67.23) ; v1(27.31,56.06) 27.31,42.47 28.32,41.45 28.32,19.29 29.4,18.21 U4.4
E1A: length 109.7
  Top Layer w0.254: v1(28.7,14.28) 24.77,14.28 20.19,18.85 v1(20.19,25.71) ; U4.34 H6.7 ; v1(62.23,37.01) 62.23,18.34 v1(57.91,14.02)
  Bottom Layer w0.254: H20.8 62.23,42.24 v1(62.23,37.01) ; v1(20.19,25.71) 15.37,25.71 U4.34 ; v1(57.91,14.02) 54.36,10.47 46.61,10.47 42.76,14.31 28.74,14.31 v1(28.7,14.28)
E1B: length 90
  Top Layer w0.254: v1(60.07,36.88) 60.07,21.39 v1(58.17,19.48) ; v1(21.59,23.42) 25.65,19.35 v1(36.19,19.35) ; H6.6 U4.35
  Bottom Layer w0.254: v1(60.07,36.88) 60.07,41.85 H20.7 ; v1(58.17,19.48) 58.04,19.35 41.16,19.35 41.13,19.39 40.15,19.39 40.12,19.35 v1(36.19,19.35) ; U4.35 15.37,23.42 v1(21.59,23.42)
E2A: length 42
  Top Layer w0.254: H20.6 51.64,47.63 48.77,44.75 48.77,26.59 45.47,23.29 H7.15 U4.6
E2B: length 59.3
  Top Layer w0.254: H20.5 54.36,47.92 54.36,54.03 53.47,54.92 49.66,54.92 47.12,52.38 47.12,30.15 42.8,25.83 H7.14 U4.7
GW_SCL: length 132.5
  Top Layer w0.254: CN1.4 47.62,98.09 10.29,98.09 1.91,89.71 1.91,23.29 4.44,20.75 H6.5 U4.36
GW_SDA: length 126.3
  Top Layer w0.254: H6.4 U4.37
  Bottom Layer w0.254: H6.4 2.03,21.26 2.03,82.6 15.75,96.32 CN1.5
KEY0: length 104.6
  Top Layer w0.254: CN1.3 40,84.38 20.32,84.38 18.48,82.54 KEY0.1 16.19,78.03 13.08,78.03 11.83,79.28 C5.1 v1(7.98,80.31) ; U4.27 H6.14
  Bottom Layer w0.254: v1(7.98,80.31) 7.98,75.12 10.54,72.57 10.54,49.07 H6.14
KEY1: length 121.6
  Top Layer w0.254: H6.15 U4.26 ; v1(71.74,68.83) C1.1 78.1,70.79 81.28,70.79 83,69.08 KEY1.1
  Bottom Layer w0.254: U4.26 22.1,53.01 22.1,59.11 24.26,61.27 40.77,61.27 43.05,63.55 43.05,83.24 43.56,83.74 65.41,83.74 70.1,79.05 70.1,74.6 71.74,72.97 v1(71.74,68.83)
KEY2: length 116.6
  Top Layer w0.254: U4.25 H6.16 ; KEY2.1 83,75.3 81.15,77.14 78.06,77.14 C2.1 v1(71.74,75.21)
  Bottom Layer w0.254: U4.25 20.45,53.9 20.45,59.74 23.5,62.79 40.26,62.79 41.53,64.06 41.53,84 42.8,85.27 66.04,85.27 71.74,79.57 v1(71.74,75.21)
KEY3: length 111
  Top Layer w0.254: KEY3.1 83,81.78 81.15,83.62 78.16,83.62 C3.1 v1(71.74,81.6) ; H6.17 U4.24
  Bottom Layer w0.254: v1(71.74,81.6) 66.55,86.79 42.67,86.79 40.39,84.51 40.39,64.95 39.5,64.06 22.99,64.06 19.18,60.25 19.18,55.17 U4.24
KEY4: length 108.3
  Top Layer w0.254: H6.18 U4.23 ; KEY4.1 83,88.51 81.41,90.09 78.25,90.09 C4.1 v1(71.74,87.98)
  Bottom Layer w0.254: v1(71.74,87.98) 42.21,87.98 39.24,85.01 39.24,65.84 38.61,65.2 22.35,65.2 18.03,60.88 18.03,55.8 16,53.77 U4.23
LED_G: length 30.2
  Top Layer w0.254: U4.22 H6.19
  Bottom Layer w0.254: H6.19 5.97,56.31 6.98,57.33 6.98,60.38 4.83,62.53 4.83,68.63 6.68,70.49 v1(6.68,73.33)
LED_R: length 27.2
  Top Layer w0.254: H6.20 U4.21
  Bottom Layer w0.254: v1(14.12,73.33) 11.94,71.15 11.94,61.65 14.73,58.85 U4.21
OLED_SCL: length 67.8
  Top Layer w0.25: U2.3 72.64,8.18 58.17,8.18 53.97,12.37 53.97,30.53 v1(53.85,30.53)
  Top Layer w0.254: H7.11 U4.10
  Bottom Layer w0.25: H7.11 48.39,33.45 50.29,31.55 52.83,31.55 v1(53.85,30.53)
OLED_SDA: length 72.1
  Top Layer w0.25: v1(55.88,32.56) 55.88,13.13 59.18,9.83 73.53,9.83 U2.4
  Top Layer w0.254: U4.11 H7.10
  Bottom Layer w0.25: H7.10 48.01,35.99 51.18,32.82 55.63,32.82 v1(55.88,32.56)
PB2: length 82.2
  Top Layer w0.254: v1(46.61,61.9) 46.61,54.92 45.97,54.28 v1(45.97,52.5) ; H7.5 U4.16 ; v1(57.66,89.84) 57.66,85.9 52.96,81.2 v1(52.96,79.81)
  Bottom Layer w0.254: v1(46.61,61.9) 52.96,68.25 v1(52.96,79.81) ; v1(45.97,52.5) 45.97,51.11 43.56,48.69 H7.5 ; H3.6 54.1,93.4 v1(57.66,89.84)
PB4: length 10.2
  Top Layer w0.254: H6.9 U4.32
PB5: length 10.2
  Top Layer w0.254: U4.33 H6.8
PC13: length 10.2
  Top Layer w0.254: U4.2 H7.19
UART1_RX: length 70.3
  Top Layer w0.25: U4.31 16.38,33.45 17.4,32.44 17.4,8.56 20.45,5.51 47.5,5.51 H5.3
  Top Layer w0.254: U4.31 H6.10
UART1_TX: length 74
  Top Layer w0.25: U4.30 16.51,35.99 18.8,33.71 18.8,9.7 21.59,6.91 48.64,6.91 H5.2
  Top Layer w0.254: H6.11 U4.30
UART2_RX: length 54.9
  Top Layer w0.254: U4.9 H7.12 40.77,30.91 42.8,32.94 42.8,70.16 U3.4
UART2_TX: length 61.8
  Top Layer w0.254: U3.3 48.26,73.58 48.26,66.98 44.32,63.04 44.32,32.06 H7.13 U4.8
UART6_RX: length 206
  Top Layer w0.254: H6.12 U4.29 18.67,41.96 v1(20.7,41.96) ; v1(74.93,22.78) 84.33,22.78 86.61,25.07 86.61,59.87 94.11,67.36 94.11,89.71 91.82,92 81.79,92 H4.3
  Bottom Layer w0.254: v1(20.7,41.96) 20.83,42.09 22.26,42.09 25.02,39.33 25.02,11.01 27.69,8.34 53.98,8.34 69.1,23.45 74.27,23.45 v1(74.93,22.78)
UART6_TX: length 212.2
  Top Layer w0.254: H4.4 93.6,94.79 96.9,91.49 96.9,64.82 95.76,63.68 93.73,63.68 89.15,59.11 89.15,23.29 86.74,20.88 v1(74.93,20.88) ; H6.13 U4.28
  Bottom Layer w0.254: U4.28 15.24,40.8 15.49,40.55 21.08,40.55 23.37,38.26 23.37,9.56 27.04,5.89 57.53,5.89 72.52,20.88 v1(74.93,20.88)
$1N1648: length 6.2
  Bottom Layer w0.254: 红灯.2 16.05,67.56 v1(16.05,73.33)
$1N1649: length 6.3
  Top Layer w0.254: 绿灯.2 8.61,67.64 R10.1

## Copper pours and planes (outline as drawn; the poured copper is in the pictures)
GND on Top Layer: -10.41,107.62 107.06,107.62 107.06,-7.31 -10.41,-7.31
GND on Bottom Layer: -10.16,106.98 107.57,106.98 107.57,-7.31 -10.16,-7.31

Small or netless copper shapes (teardrops, artwork), in the pictures only: 208 on Top Layer, 73 on Bottom Layer

## Text on the board
Top Silkscreen Layer: 10K | 1k | 100nf | +3.3V | GND | SCL | SDA | +5V | RX | KEY0 | TX | 鼠鼠我啊 | VL53L0X | HC-05蓝牙 | 西安电子科技大学 | 感为灰度 | 陀螺仪 | 4pinOLED | 通信工程学院 | K210/OPENMV | stm32F411CEU6 | AT8236稳压驱动板
